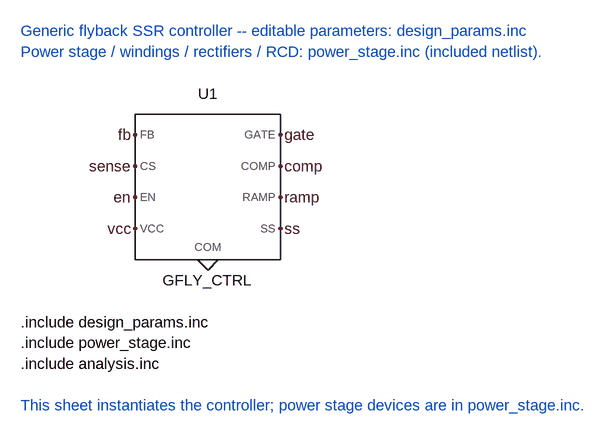
[diagram p0: schematic Flyback.asc]
Flyback.asc, the LTspice schematic file:
Version 4
SHEET 1 880 680
FLAG 256 192 fb
FLAG 256 240 sense
FLAG 256 288 en
FLAG 256 336 vcc
FLAG 480 192 gate
FLAG 480 240 comp
FLAG 480 288 ramp
FLAG 480 336 ss
FLAG 368 384 0
SYMBOL GFLY_CTRL 368 272 R0
SYMATTR InstName U1
SYMATTR Value GFLY_CTRL
SYMATTR SpiceLine FSW={FSW} MODE={MODE} DMAX={DMAX} VM={VM} A_CS={A_CS} SLOPE={SLOPE} CS_LIM={CS_LIM} TBLANK={TBLANK} TONMIN={TONMIN} TPROP={TPROP} VG={VG} RDRV={RDRV} UVLO={UVLO} VSET={VSET} TSS={TSS} TYPE={TYPE} KP={KP} FZ1={FZ1} FP1={FP1} FZ2={FZ2} FP2={FP2} CMAX={CMAX}
TEXT 80 480 Left 2 !.include design_params.inc
TEXT 80 512 Left 2 !.include power_stage.inc
TEXT 80 544 Left 2 !.include analysis.inc
TEXT 80 32 Left 2 ;Generic flyback SSR controller -- editable parameters: design_params.inc
TEXT 80 64 Left 2 ;Power stage / windings / rectifiers / RCD: power_stage.inc (included netlist).
TEXT 80 608 Left 2 ;This sheet instantiates the controller; power stage devices are in power_stage.inc.

The netlist it stands for:
* Flyback.asc
XU1 fb sense en vcc gate comp ramp ss 0 GFLY_CTRL FSW={FSW} MODE={MODE} DMAX={DMAX} VM={VM} A_CS={A_CS} SLOPE={SLOPE} CS_LIM={CS_LIM} TBLANK={TBLANK} TONMIN={TONMIN} TPROP={TPROP} VG={VG} RDRV={RDRV} UVLO={UVLO} VSET={VSET} TSS={TSS} TYPE={TYPE} KP={KP} FZ1={FZ1} FP1={FP1} FZ2={FZ2} FP2={FP2} CMAX={CMAX}  ; pins FB CS EN VCC GATE COMP RAMP SS COM
.include design_params.inc
.include power_stage.inc
.include analysis.inc
* Generic flyback SSR controller -- editable parameters: design_params.inc
* Power stage / windings / rectifiers / RCD: power_stage.inc (included netlist).
* This sheet instantiates the controller; power stage devices are in power_stage.inc.
.lib GenericFlybackPWM.lib
.backanno
.end